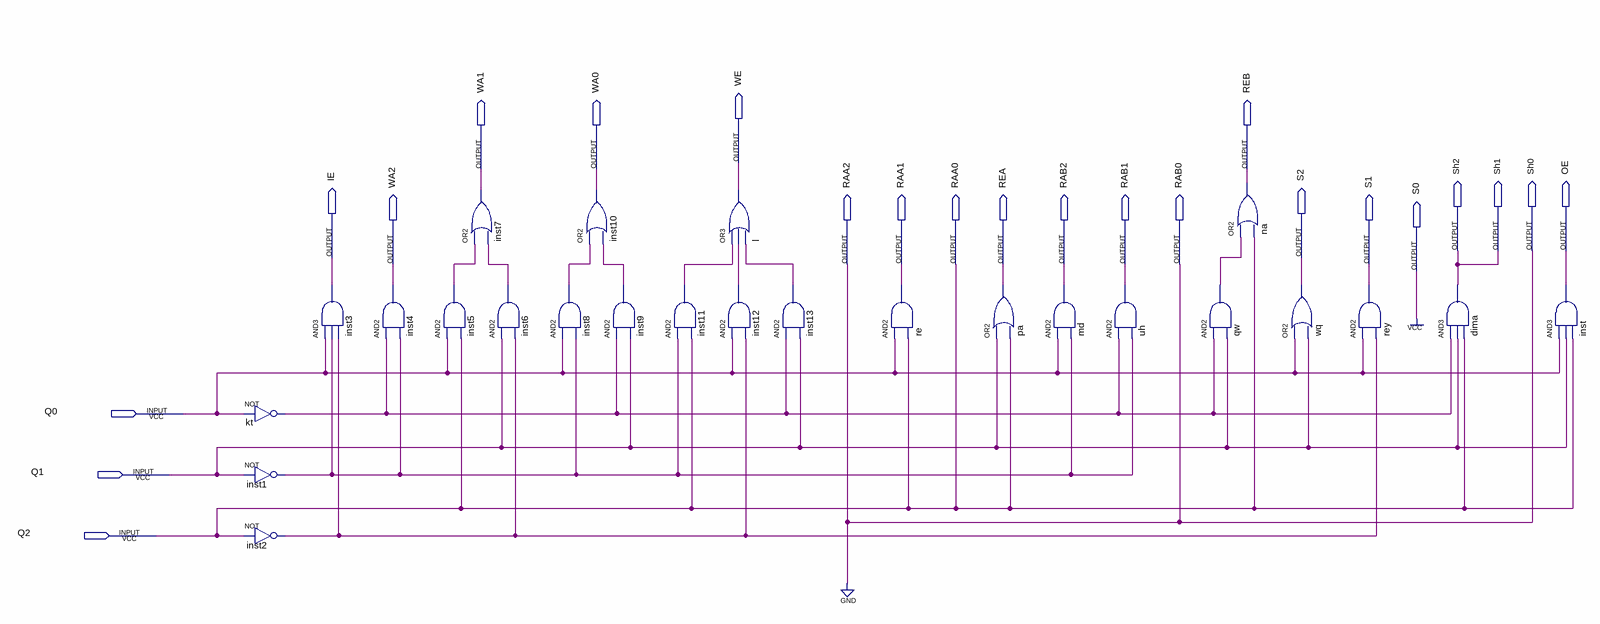
[diagram p0: schematic sheet]
// Quartus schematic output_logic.bdf as structural Verilog: 25 symbols, 23 pins
module output_logic (
  input  Q0,
  input  Q1,
  input  Q2,
  output WE,
  output WA1,
  output WA0,
  output REB,
  output Sh2,
  output Sh1,
  output Sh0,
  output OE,
  output IE,
  output S2,
  output WA2,
  output RAA2,
  output RAA1,
  output RAA0,
  output REA,
  output RAB2,
  output RAB1,
  output RAB0,
  output S1,
  output S0
);

  wire inst1_out, inst2_out, inst5_out, inst6_out, inst8_out, inst9_out, inst11_out, inst12_out, inst13_out,
       kt_out, qw_out;

  not kt (kt_out, Q0);
  not inst1 (inst1_out, Q1);
  not inst2 (inst2_out, Q2);
  and inst3 (IE, Q0, inst1_out, inst2_out);
  and inst4 (WA2, kt_out, inst1_out);
  or inst7 (WA1, inst5_out, inst6_out);
  and inst5 (inst5_out, Q0, Q2);
  and inst6 (inst6_out, Q1, inst2_out);
  or inst10 (WA0, inst8_out, inst9_out);
  and inst8 (inst8_out, Q0, inst1_out);
  and inst9 (inst9_out, kt_out, Q1);
  and inst11 (inst11_out, inst1_out, Q2);
  or l (WE, inst11_out, inst12_out, inst13_out);
  and inst12 (inst12_out, Q0, inst2_out);
  and inst13 (inst13_out, kt_out, Q1);
  and re (RAA1, Q0, Q2);
  or pa (REA, Q1, Q2);
  and md (RAB2, Q0, inst1_out);
  and uh (RAB1, kt_out, inst1_out);
  or na (REB, qw_out, Q2);
  and qw (qw_out, kt_out, Q1);
  or wq (S2, Q0, Q1);
  and rey (S1, Q0, inst2_out);
  and dima (Sh1, kt_out, Q1, Q2);
  and inst (OE, Q0, Q1, Q2);

  assign RAA0 = Q2;
  assign RAA2 = 1'b0;
  assign RAB0 = 1'b0;
  assign S0 = 1'b1;
  assign Sh0 = 1'b0;
  assign Sh2 = Sh1;
endmodule
